# EasyEDA Pro project ProPrj_ESPRESSIF32-S3_CLOCK_BAT_2026-10-18.epro

# Schematic Schematic1

## Sheets
1 schematic: Assembly Variant: Basic; Board Name: Board1; Create Date: 2026-10-18; Page Name: P1; Project Name: 8266_timer_v2; Schematic Name: Schematic1; Update Date: 2026-10-18; Company: 嘉立创EDA; Page Size: A4; Version: V1.0
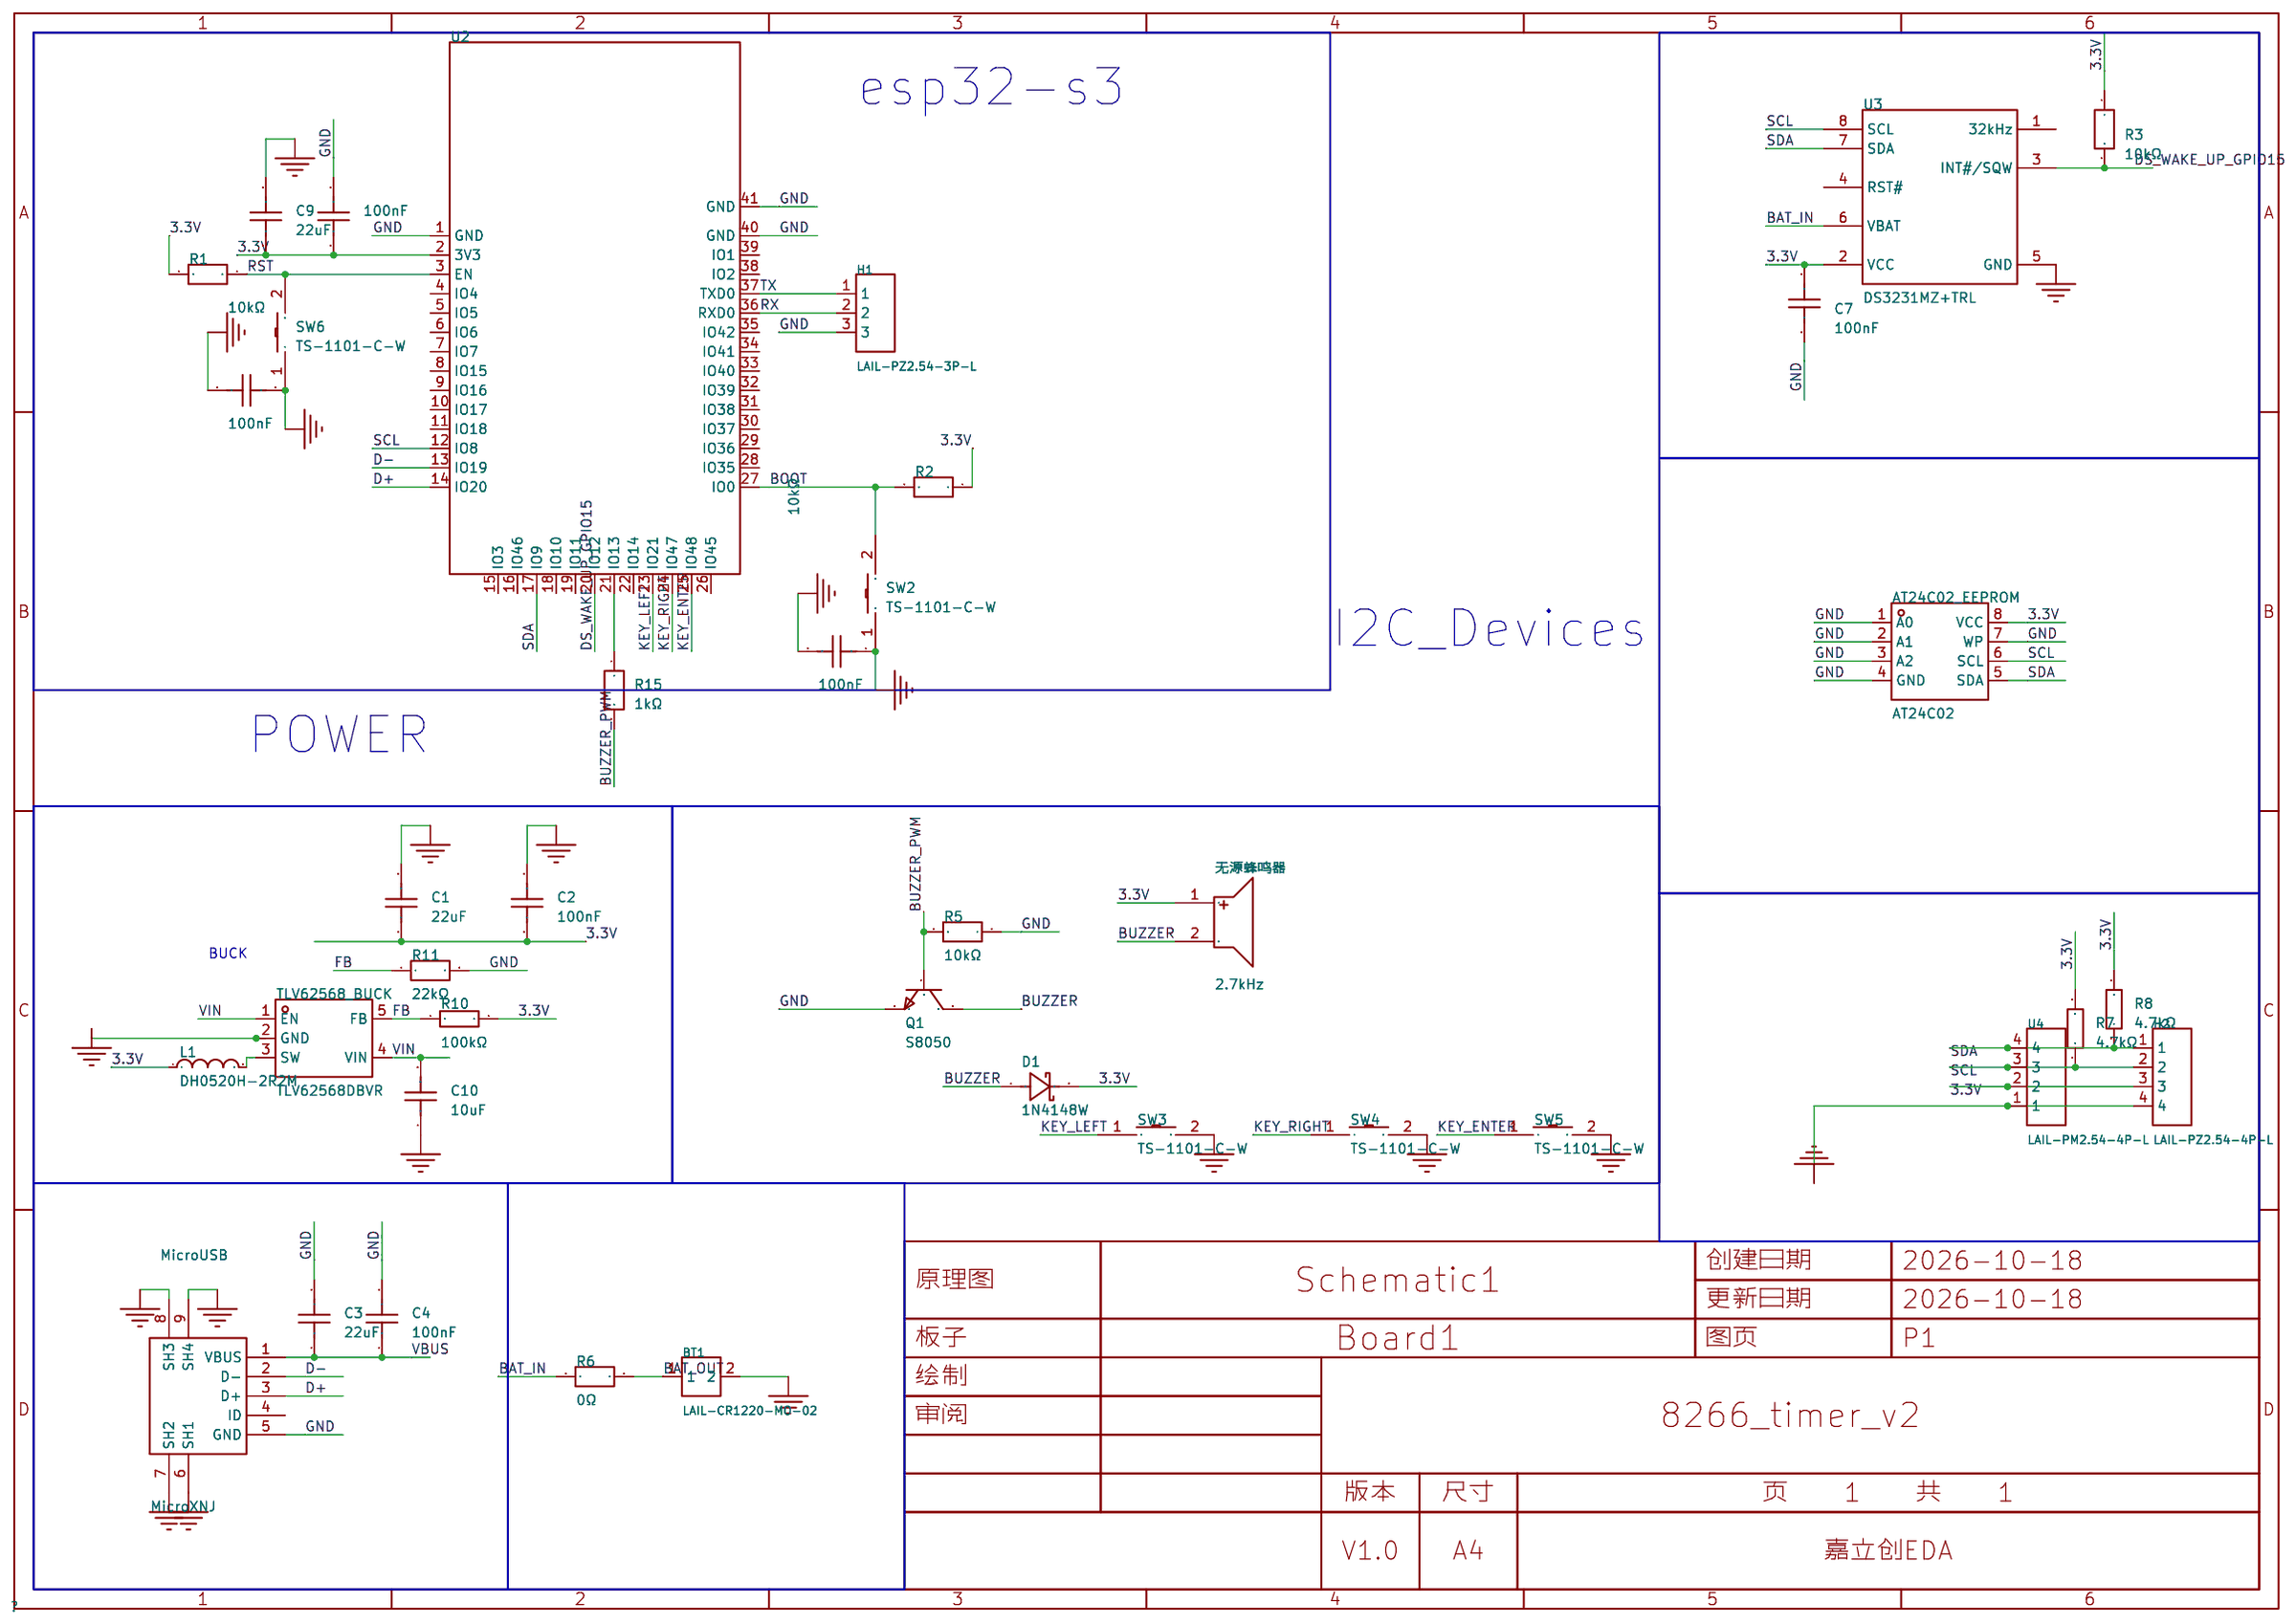
[diagram p0: schematic]
2 bat: Schematic Name: Schematic2
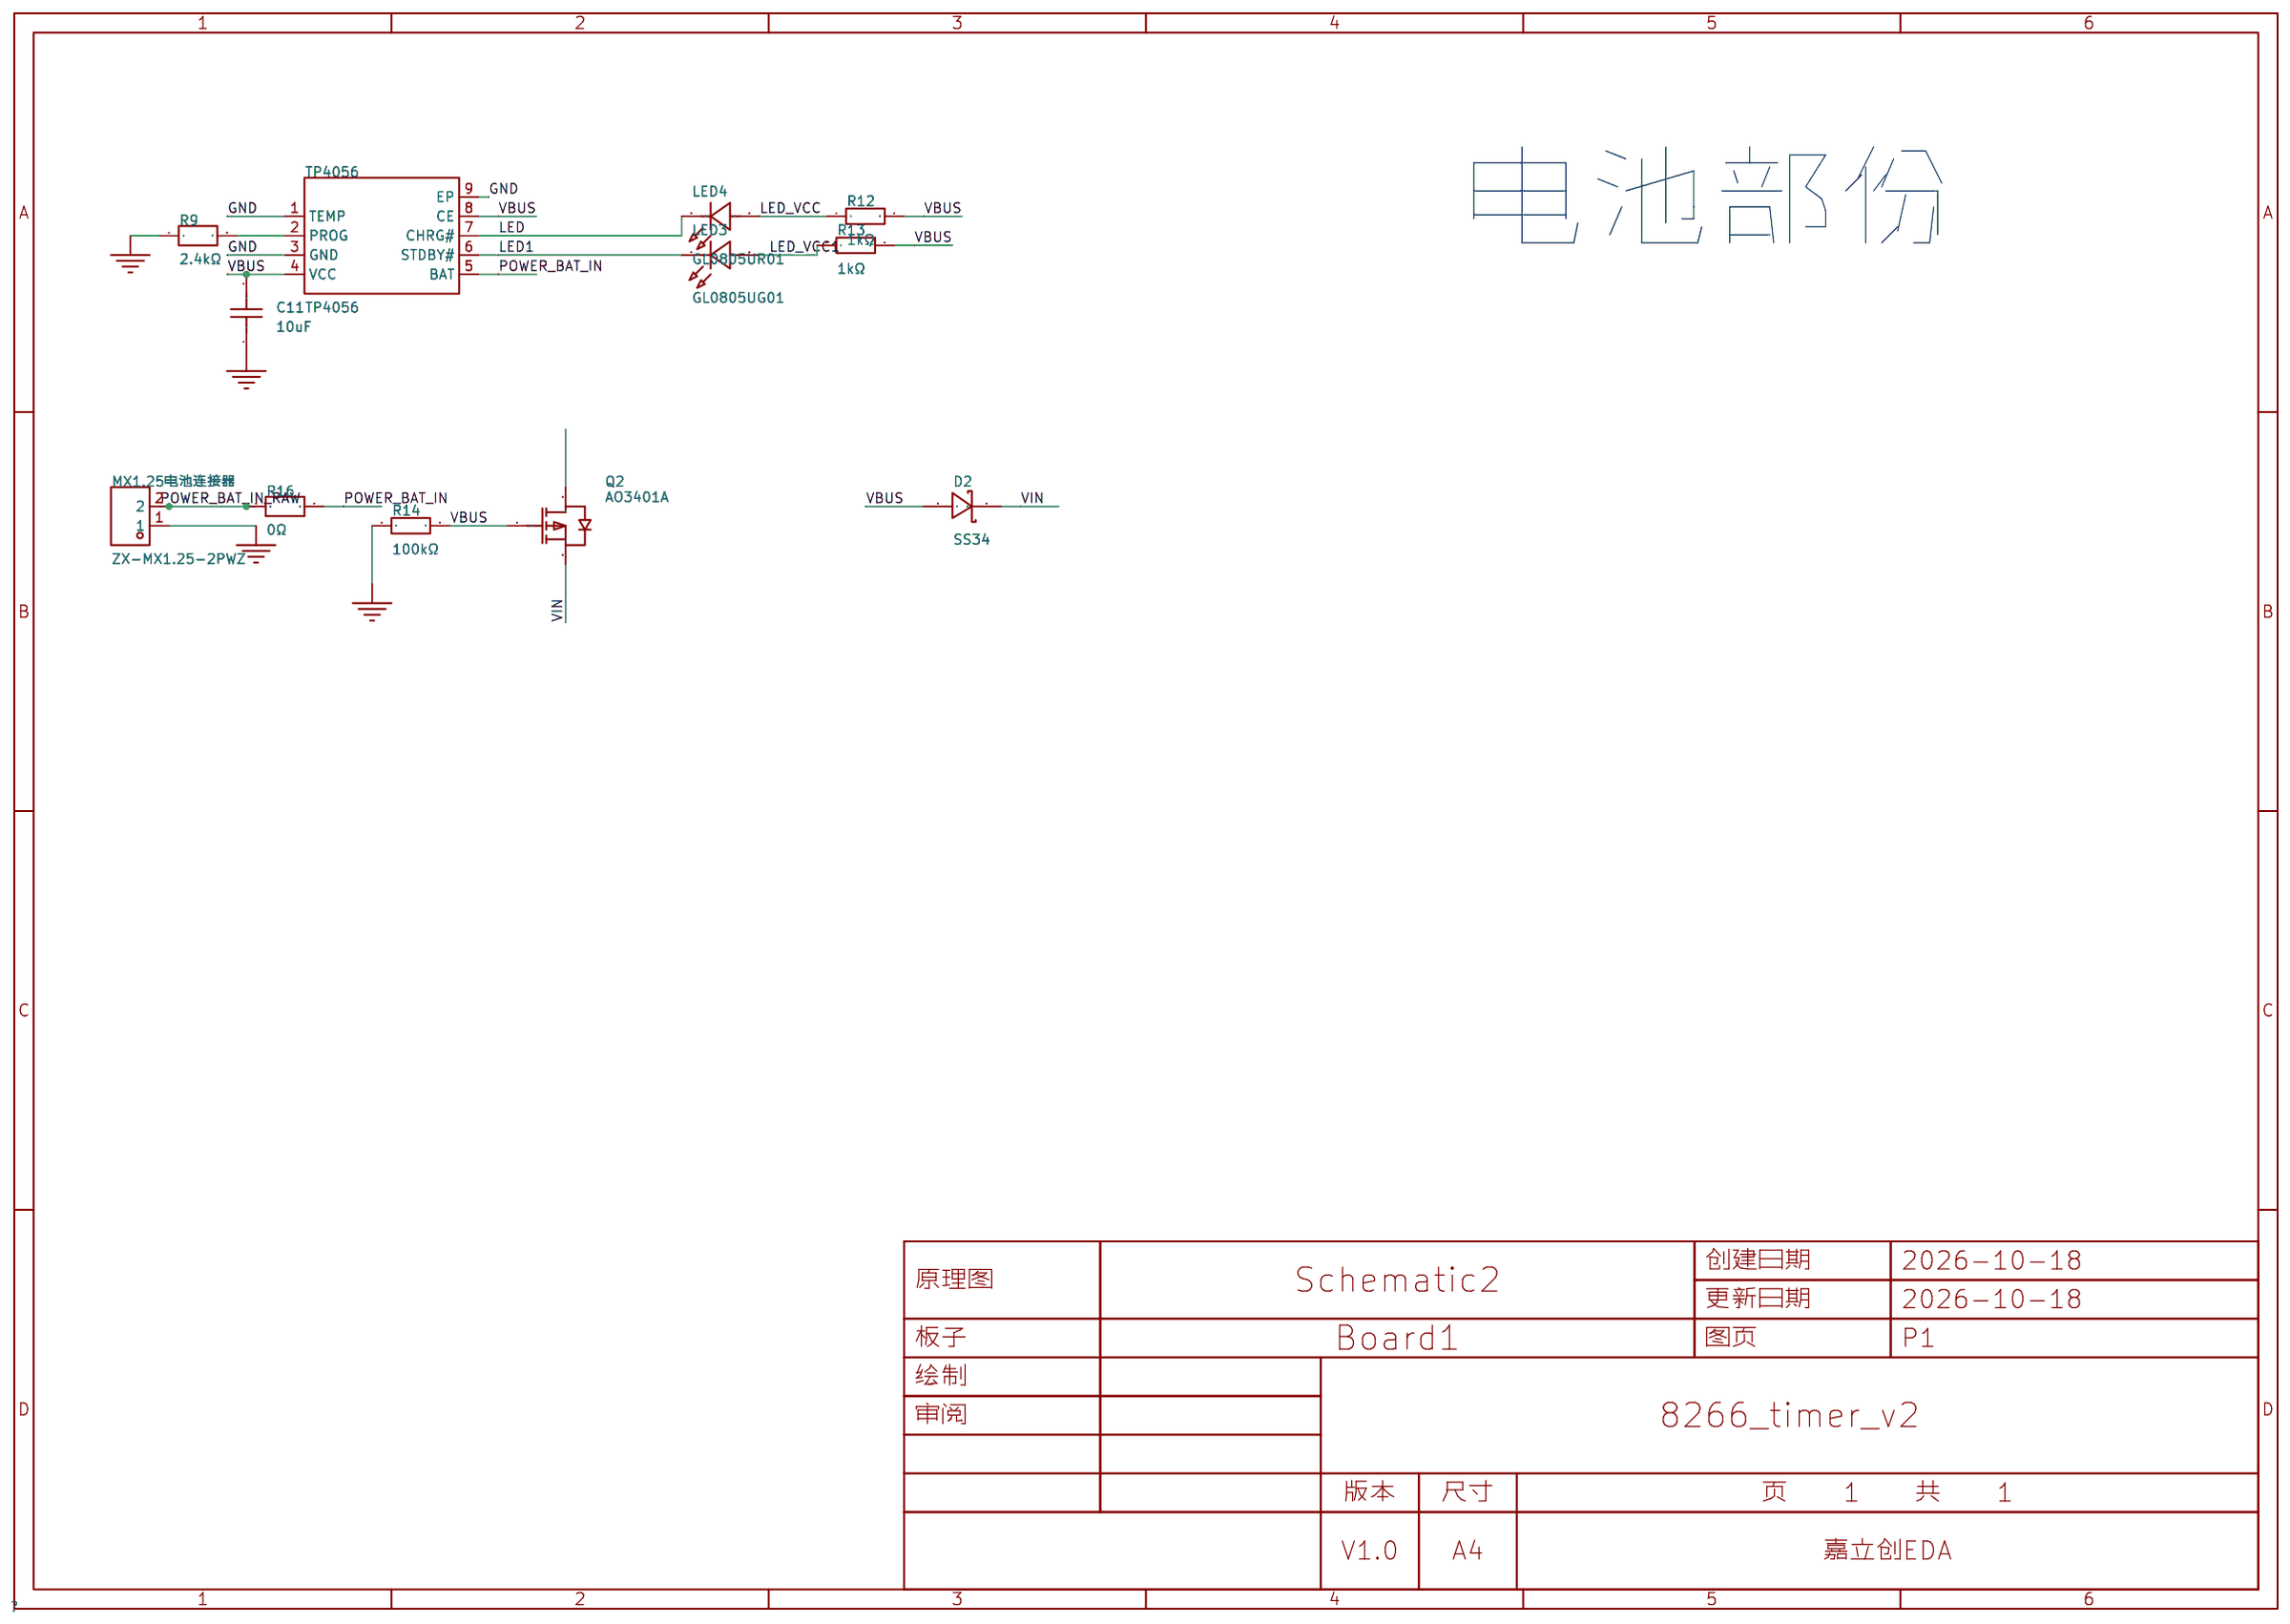
[diagram p1: bat]

## Parts
sheet bat
C11  10uF  [C0805]
D2  SS34  [SMC_L6.9-W5.9-LS7.9-RD]
LED3  GL0805UG01  [LED0805-FD_GL0805UG01]
LED4  GL0805UR01  [LED0805-R-RD_RED]
MX1.25电池连接器  ZX-MX1.25-2PWZ  [CONN-TH_2P-P1.25_ZX-MX1.25-2PWZ]
Q2  AO3401A  [SOT-23_L2.9-W1.3-P1.90-LS2.4-BR]
R9  2.4kΩ  [R0603]
R12  1kΩ  [R0805]
R13  1kΩ  [R0805]
R14  100kΩ  [R0805]
R16  0Ω  [R1206]
TP4056  TP4056  [ESOP-8_L4.9-W3.9-P1.27-LS6.0-BL-EP]
sheet schematic
AT24C02_EEPROM  AT24C02  [SOP-8_L5.0-W4.0-P1.27-LS6.0-BL]
BT1  LAIL-CR1220-MO-02  [BAT_TH_LAIL-CR1220-MO-02]
C1  22uF  [C1210]
C2  100nF  [C0805]
C3  22uF  [C0805]
C4  100nF  [C0805]
C5  100nF  [C0805]
C6  100nF  [C0805]
C7  100nF  [C0805]
C8  100nF  [C0805]
C9  22uF  [C1210]
C10  10uF  [C0805]
D1  1N4148W  [SOD-123_L2.7-W1.6-LS3.7-FD]
H1  LAIL-PZ2.54-3P-L  [HDR-TH_3P-P2.54-V-M-1]
H2  LAIL-PZ2.54-4P-L  [CONN-TH_LAIL-PZ2.54-4P-L]
L1  DH0520H-2R2M  [IND-SMD_L5.6-W5.2_MST0530H-150M]
MicroUSB  MicroXNJ  [MICRO-USB-SMD_MICROXNJ_1]
Q1  S8050  [SOT-23-3_L2.9-W1.3-P1.90-LS2.3-BR]
R1  10kΩ  [R0603]
R2  10kΩ  [R0603]
R3  10kΩ  [R0603]
R5  10kΩ  [R0603]
R6  0Ω  [R1206]
R7  4.7kΩ  [R0603]
R8  4.7kΩ  [R0603]
R10  100kΩ  [R0805]
R11  22kΩ  [R0805]
R15  1kΩ  [R0603]
SW2  TS-1101-C-W  [SW-SMD_L6.0-W3.3-LS8.0_TS-1101-C-W]
SW3  TS-1101-C-W  [SW-SMD_L6.0-W3.3-LS8.0_TS-1101-C-W]
SW4  TS-1101-C-W  [SW-SMD_L6.0-W3.3-LS8.0_TS-1101-C-W]
SW5  TS-1101-C-W  [SW-SMD_L6.0-W3.3-LS8.0_TS-1101-C-W]
SW6  TS-1101-C-W  [SW-SMD_L6.0-W3.3-LS8.0_TS-1101-C-W]
TLV62568_BUCK  TLV62568DBVR  [SOT-23-5_L3.0-W1.7-P0.95-LS2.8-BR]
U2  2.4GHz  [WIRELM-SMD_ESP32-S3-WROOM-1]
U3  DS3231MZ+TRL  [SOIC-8_L4.9-W3.9-P1.27-LS6.0-BL]
U4  LAIL-PM2.54-4P-L  [HDR-TH_4P-P2.54-V-F]
无源蜂鸣器  2.7kHz  [BUZ-TH_BD9.0-P4.00-D0.6-FD]

## Library data of the parts
C10 C11 = CL21A106KAYNNNE_C15850: 容值:10uF;精度:±10%;额定电压:25V;温度系数:X5R;; LCSC Part Name: 10uF ±10% 25V; Supplier Part: C15850; Manufacturer: SAMSUNG(三星); Manufacturer Part: CL21A106KAYNNNE; Supplier Footprint: 0805; JLCPCB Part Class: Basic Part; Datasheet: https://item.szlcsc.com/datasheet/CL21A106KAYNNNE/16532.html; Supplier: LCSC; Tolerance: ±10%; Voltage Rating: 25V; Temperature Coefficient: X5R
D2 = SS34_C154551: 正向压降(Vf):500mV@3A;直流反向耐压(Vr):40V;整流电流:3A;; LCSC Part Name: 电压:40V 电流:3A; Supplier Part: C154551; Manufacturer: onsemi(安森美); Supplier Footprint: SMC(DO-214AB); JLCPCB Part Class: Extended Part; Datasheet: https://item.szlcsc.com/datasheet/SS34/165893.html; Supplier: LCSC; Voltage - Forward(Vf@If): 500mV@3A; Voltage - DC Reverse(Vr): 40V; Current - Rectified: 3A; Reverse Leakage Current (Ir): 500uA@40V; Operating Junction Temperature Range: -55℃~+150℃; Non-Repetitive Peak Forward Surge Current: 100A
LED3 = GL0805UG01: 灯头类型:2mmx1.25mm方形灯头;发光颜色:翠绿色;正向压降(Vf):2.5V~3V;功率:-;测试电流:5mA;波长:510nm~531nm;二极管配置:独立二极管;透镜颜色:无色透明透镜;色温:-;发光强度:144mcd~300mcd;发光角度:120°;载带方式:正贴;工作温度:-40℃~+85℃;; LCSC Part Name: 0805 翠绿 高亮; Supplier Part: C51933308; Manufacturer: Guiguang light(桂光光电); Supplier Footprint: 0805; JLCPCB Part Class: Extended Part; Datasheet: https://item.szlcsc.com/datasheet/GL0805UG01/54646004.html; Supplier: LCSC; Lamp Holder Type: 2mmx1.25mm方形灯头; Illumination Color: 翠绿色; Voltage - Forward(Vf): 2.5V~3V; Test Current: 5mA; Wavelength - Dominant: 510nm~531nm; Diode Configuration: 独立二极管; Lens Color: 无色透明透镜; Luminous Intensity: 144mcd~300mcd; Viewing Angle: 120°; Mounting Style: 正贴; Operating Temperature: -40℃~+85℃
LED4 = GL0805UR01: 灯头类型:2mmx1.25mm方形灯头;发光颜色:红色;正向压降(Vf):1.8V~2.1V;功率:-;测试电流:20mA;波长:620nm~625nm;二极管配置:独立二极管;透镜颜色:无色透明透镜;色温:-;发光强度:80mcd~100mcd;发光角度:120°;载带方式:正贴;工作温度:-40℃~+85℃;; LCSC Part Name: 0805 红灯 高亮; Supplier Part: C51933307; Manufacturer: Guiguang light(桂光光电); Supplier Footprint: 0805; JLCPCB Part Class: Extended Part; Datasheet: https://item.szlcsc.com/datasheet/GL0805UR01/54646003.html; Supplier: LCSC; Lamp Holder Type: 2mmx1.25mm方形灯头; Illumination Color: 红色; Voltage - Forward(Vf): 1.8V~2.1V; Test Current: 20mA; Wavelength - Dominant: 620nm~625nm; Diode Configuration: 独立二极管; Lens Color: 无色透明透镜; Luminous Intensity: 80mcd~100mcd; Viewing Angle: 120°; Mounting Style: 正贴; Operating Temperature: -40℃~+85℃
MX1.25电池连接器 = ZX-MX1.25-2PWZ: 插针结构:1x2P;间距:1.25mm;安装方式:弯插;参考系列:PicoBlade(MX 1.25);总PIN数:2P;排数:1;每排PIN数:2;行距:-;额定电流:1A;触头材质:黄铜;触头镀层:锡;工作温度:-25℃~+85℃;; LCSC Part Name: 1x2P 间距:1.25mm 弯插 系列:PicoBlade(MX 1.25); Supplier Part: C7430463; Manufacturer: Megastar(兆星); Supplier Footprint: 弯插,P=1.25mm; JLCPCB Part Class: Extended Part; Datasheet: https://item.szlcsc.com/datasheet/ZX-MX1.25-2PWZ/8430332.html; Supplier: LCSC; Pins Structure: 1x2P; Pitch: 1.25mm; Mounting Type: 弯插; Reference Series: PicoBlade(MX 1.25); Number of Pins: 2P; Number of Rows: 1; Number of PINs Per Row: 2; Current Rating: 1A; Contact Material: 黄铜; Contact Plating: 锡; Operating Temperature: -25℃~+85℃; Voltage Rating: 125V; Plastic Material: LCP; Flame Retardant Rating: UL94V-0; Color: 米色; Z-Height of the Board: 3.3mm; X-Length of Bottom Edge on Board (Spacing Line): 4.4mm; Y-Width of Bottom Edge on Board: 4.6mm
Q2 = AO3401A_C15127: 数量:1个P沟道;漏源电压(Vdss):30V;连续漏极电流(Id):4A;导通电阻(RDS(on)):47mΩ@10V；85mΩ@2.5V；60mΩ@4.5V;耗散功率(Pd):-;阈值电压(Vgs(th)):900mV;; LCSC Part Name: 1个P沟道 耐压:30V 电流:4A; Supplier Part: C15127; Manufacturer: AOS; Supplier Footprint: SOT-23; JLCPCB Part Class: Basic Part; Datasheet: https://item.szlcsc.com/datasheet/AO3401A/15801.html; Supplier: LCSC; Number: 1个P沟道; Drain to Source Voltage: 30V; Current - Continuous Drain(Id): 4A; RDS(on): 47mΩ@10V；85mΩ@2.5V；60mΩ@4.5V; Gate Threshold Voltage (Vgs(th)): 900mV; Gate Charge(Qg): 14nC@10V; Input Capacitance(Ciss): 645pF; Reverse Transfer Capacitance (Crss@Vds): 55pF; Output Capacitance(Coss): 80pF
R9 = FRC0603F2401TS: 电阻类型:厚膜电阻;阻值:2.4kΩ;精度:±1%;功率:100mW;工作电压:75V;温度系数:±100ppm/℃;; LCSC Part Name: 2.4kΩ ±1% 100mW 厚膜电阻; Supplier Part: C2907007; Manufacturer: FOJAN(富捷); Supplier Footprint: 0603; JLCPCB Part Class: Extended Part; Supplier: LCSC; Type: 厚膜电阻; Tolerance: ±1%; Power(Watts): 100mW; Voltage-Supply(Max): 75V; Temperature Coefficient: ±100ppm/℃; Operating Temperature: -55℃~+155℃
R12 R13 = 0805W8F1001T5E: 电阻类型:厚膜电阻;阻值:1kΩ;精度:±1%;功率:125mW;最大工作电压:150V;温度系数:±100ppm/℃;; LCSC Part Name: 1kΩ ±1% 125mW 厚膜电阻; Supplier Part: C17513; Manufacturer: UNI-ROYAL(厚声); Supplier Footprint: 0805; JLCPCB Part Class: Basic Part; Datasheet: https://atta.szlcsc.com/upload/public/pdf/source/20200306/C422600_1E6D84923E4A46A82E41ADD87F860B5C.pdf; Supplier: LCSC; Type: 厚膜电阻; Tolerance: ±1%; Power(Watts): 125mW; Overload Voltage (Max): 150V; Temperature Coefficient: ±100ppm/℃; Operating Temperature Range: -55℃~+155℃
R10 R14 = 0805W8F1003T5E: 电阻类型:厚膜电阻;阻值:100kΩ;精度:±1%;功率:125mW;工作电压:150V;温度系数:±100ppm/℃;; LCSC Part Name: 100kΩ ±1% 125mW 厚膜电阻; Supplier Part: C149504; Manufacturer: UNI-ROYAL(厚声); Supplier Footprint: 0805; JLCPCB Part Class: Basic Part; Datasheet: https://item.szlcsc.com/datasheet/0805W8F1003T5E/160838.html; Supplier: LCSC; Type: 厚膜电阻; Tolerance: ±1%; Power(Watts): 125mW; Voltage-Supply(Max): 150V; Temperature Coefficient: ±100ppm/℃; Operating Temperature: -55℃~+155℃
R6 R16 = RE1206F1R000: 电阻类型:采样电阻；合金电阻;阻值:0Ω;精度:±1%;功率:1W;安装方式:贴片;; LCSC Part Name: 0Ω 1W 1206 ±1%; Supplier Part: C46961765; Manufacturer: JIERR(捷而瑞); Supplier Footprint: 1206; JLCPCB Part Class: Extended Part; Datasheet: https://item.szlcsc.com/datasheet/RE1206F1R000/49133304.html; Supplier: LCSC; Type: 采样电阻；合金电阻; Tolerance: ±1%; Power(Watts): 1W; Mounting Type: 贴片
TP4056 = TP4056_C725790: 工作电压:4V~6.5V;最大充电电流:1A;电池类型:锂电池;电池节数:1;; LCSC Part Name: 1A独立式线性锂离子电池充电器; Supplier Part: C725790; Manufacturer: UMW(友台半导体); Supplier Footprint: ESOP-8; JLCPCB Part Class: Extended Part; Datasheet: https://item.szlcsc.com/datasheet/TP4056/772193.html; Supplier: LCSC; The Chip Type: 充电芯片; Voltage - Supply: 4V~6.5V; Charge Current - Max: 1A; Charging Saturation Voltage: 4.2V; Type of Battery: 锂电池; Number of Cells: 1; Operating Temperature: -40℃~+85℃; Battery Temperature Detection: 支持; 0V Battery Charge: 支持; Supply Current (Iq): 35uA; Features: 恒压充电；恒流充电；自动再充电；充电终止；软启动；可编程充电电流；欠压锁定；涓流充电
AT24C02_EEPROM = AT24C02_C688857: 接口类型:I2C;存储容量:2Kbit;时钟频率(fc):1MHz;; LCSC Part Name: 24C02 2Kbit电可擦除PROM; Supplier Part: C688857; Manufacturer: IDCHIP(英锐芯); Supplier Footprint: SOP-8; JLCPCB Part Class: Extended Part; Datasheet: https://item.szlcsc.com/datasheet/AT24C02/721923.html; Supplier: LCSC; Interface: I2C; Memory Size: 2Kbit; Clock Frequency: 1MHz; Write Cycle Time(Tw): 5ms; Data Retention - TDR (Year): 100年; Write Cycle Endurance: 100万次; Features: 硬件写保护功能；噪声抑制功能; Voltage - Supply: 1.8V~5.5V; Operating Temperature: -40℃~+85℃; Operating Current: 1mA; Standby Current: 1uA; Access Time: 900ns
BT1 = LAIL-CR1220-MO-02: 连接器类型:电池扣;适用电池规格:CR1220;触头材质:磷青铜;触头镀层:镍;工作温度:-25℃~+85℃;; LCSC Part Name: 电池扣 适用电池:CR1220; Supplier Part: C55318146; Manufacturer: LAILAN(莱联); Supplier Footprint: 插件; JLCPCB Part Class: Extended Part; Datasheet: https://item.szlcsc.com/datasheet/LAIL-CR1220-MO-02/59240639.html; Supplier: LCSC; Connector Type: 电池扣; Battery Type: CR1220; Contact Material: 磷青铜; Contact Plating: 镍; Operating Temperature: -25℃~+85℃
C1 C9 = CL32A226KAJNNNE: 容值:22uF;精度:±10%;额定电压:25V;温度系数:X5R;; LCSC Part Name: 22uF ±10% 25V; Supplier Part: C52306; Manufacturer: SAMSUNG(三星); Supplier Footprint: 1210; JLCPCB Part Class: Extended Part; Datasheet: https://item.szlcsc.com/datasheet/CL32A226KAJNNNE/53320.html; Supplier: LCSC; Tolerance: ±10%; Voltage Rating: 25V; Temperature Coefficient: X5R
C2 C4 C7 = CL21B104KBCNNNC: 容值:100nF;精度:±10%;额定电压:50V;温度系数:X7R;; LCSC Part Name: 100nF ±10% 50V; Supplier Part: C1711; Manufacturer: SAMSUNG(三星); Supplier Footprint: 0805; JLCPCB Part Class: Extended Part; Datasheet: https://item.szlcsc.com/datasheet/CL21B104KBCNNNC/2063.html; Supplier: LCSC; Tolerance: ±10%; Voltage Rating: 50V; Temperature Coefficient: X7R
C3 = HGC0805R5226M250NSLJ: 容值:22uF;精度:±20%;额定电压:25V;温度系数:X5R;; LCSC Part Name: 22uF ±20% 25V; Supplier Part: C33546009; Manufacturer: Chinocera(华瓷); Supplier Footprint: 0805; JLCPCB Part Class: Extended Part; Datasheet: https://item.szlcsc.com/datasheet/HGC0805R5226M250NSLJ/35278487.html; Supplier: LCSC; Tolerance: ±20%; Voltage Rating: 25V; Temperature Coefficient: X5R
C5 C6 C8 = CC0805KRX7R9BB104: 容值:100nF;精度:±10%;额定电压:50V;温度系数:X7R;; LCSC Part Name: 100nF ±10% 50V; Supplier Part: C49678; Manufacturer: YAGEO(国巨); Supplier Footprint: 0805; JLCPCB Part Class: Basic Part; Datasheet: https://item.szlcsc.com/datasheet/CC0805KRX7R9BB104/50686.html; Supplier: LCSC; Tolerance: ±10%; Voltage Rating: 50V; Temperature Coefficient: X7R
D1 = 1N4148W_C7420318: 二极管配置:独立式;整流电流:150mA;直流反向耐压(Vr):100V;正向压降(Vf):1.25V@150mA;反向恢复时间(Trr):4ns;; LCSC Part Name: 100V 150mA; Supplier Part: C7420318; Manufacturer: R+O(宏嘉诚); Supplier Footprint: SOD-123; JLCPCB Part Class: Extended Part; Datasheet: https://item.szlcsc.com/datasheet/1N4148W/8397140.html; Supplier: LCSC; Diode Configuration: 独立式; Pd - Power Dissipation: 400mW; Current - Rectified: 150mA; Voltage - DC Reverse(Vr): 100V; Voltage - Forward(Vf@If): 1.25V@150mA; Non-Repetitive Peak Forward Surge Current: 2A; Reverse Leakage Current (Ir): 1uA@75V; Reverse Recovery Time (trr): 4ns; Operating Junction Temperature Range: -55℃~+150℃
H1 = LAIL-PZ2.54-3P-L: 插针结构:1x3P;间距:2.54mm;圆针/方针:方针;安装方式:直插;排数:单排;总PIN位数:3P;额定电流:3A;额定电压:250V;配合针长度:6mm;塑高:2.5mm;端接针长度:3mm;触头材质:黄铜;触头镀层:金;工作温度:-25℃~+80℃;颜色:黑色;; LCSC Part Name: 1x3P 间距:2.54mm 方针 直插; Supplier Part: C54950604; Manufacturer: LAILAN(莱联); Supplier Footprint: 插件,P=2.54mm; JLCPCB Part Class: Extended Part; Datasheet: https://item.szlcsc.com/datasheet/LAIL-PZ2.54-3P-L/58519957.html; Supplier: LCSC; Pin Structure: 1x3P; Pitch: 2.54mm; Circluar Pins/Square Pins: 方针; Mounting Type: 直插; Number of Rows: 单排; Number of Pins: 3P; Current Rating: 3A; Voltage Rating (Max): 250V; Length of Mating Pin: 6mm; Insulation Height: 2.5mm; Length of End Connection Pin: 3mm; Contact Material: 黄铜; Contact Plating: 金; Operating Temperature: -25℃~+80℃; Color: 黑色
H2 = LAIL-PZ2.54-4P-L: 插针结构:1x4P;间距:2.54mm;圆针/方针:方针;安装方式:直插;排数:单排;总PIN位数:4P;额定电流:3A;额定电压:250V;配合针长度:6mm;塑高:2.5mm;端接针长度:3mm;触头材质:黄铜;触头镀层:金;工作温度:-25℃~+80℃;颜色:黑色;; LCSC Part Name: 1x4P 间距:2.54mm 方针 直插; Supplier Part: C54950602; Manufacturer: LAILAN(莱联); Supplier Footprint: 插件,P=2.54mm; JLCPCB Part Class: Extended Part; Datasheet: https://item.szlcsc.com/datasheet/LAIL-PZ2.54-4P-L/58519955.html; Supplier: LCSC; Pin Structure: 1x4P; Pitch: 2.54mm; Circluar Pins/Square Pins: 方针; Mounting Type: 直插; Number of Rows: 单排; Number of Pins: 4P; Current Rating: 3A; Voltage Rating (Max): 250V; Length of Mating Pin: 6mm; Insulation Height: 2.5mm; Length of End Connection Pin: 3mm; Contact Material: 黄铜; Contact Plating: 金; Operating Temperature: -25℃~+80℃; Color: 黑色
L1 = DH0520H-2R2M: 一体成型电感，功率电感，合金电感，贴片电感.公司通过ISO90001:2015和IATF16949:2016体系认证，产品主要应用于：汽车电子(车灯、车机屏、BMS、自动驾驶控制模块等)、电脑主板(台式、笔记本、平板)、显卡、交换机、路由器、电视机、显示器、音箱、手机、通讯基站、各种机器设备控制板等。; LCSC Part Name: DH0520H-2R2M（2.2uH); Supplier Part: C41407019; Manufacturer: DH(德鸿感应); Supplier Footprint: SMD,5.6x5.2mm; Datasheet: https://item.szlcsc.com/datasheet/DH0520H-2R2M/43206035.html; Supplier: LCSC
MicroUSB = MicroXNJ: 连接器类型:Micro-B;协议标准:USB 2.0;公母:母;安装方式:卧贴;触点数量:5P;端口数量:1;额定电流 - 电源:1.8A;工作温度:-30℃~+80℃;; LCSC Part Name: Micro-B 母 卧贴; Supplier Part: C404969; Manufacturer: SHOU HAN(首韩); Supplier Footprint: SMD; JLCPCB Part Class: Extended Part; Datasheet: https://item.szlcsc.com/datasheet/MicroXNJ/392534.html; Supplier: LCSC; Connector Type: Micro-B; Protocol Standard: USB 2.0; Gender: 母; Mounting Type: 卧贴; Number of Contacts: 5P; Number of Ports: 1; Current Rating-Power: 1.8A; Voltage Rating: 30V; Connect-Disconnect Life: 2千次; Length: 5.7mm; Detection color: 黑色; Operating Temperature: -30℃~+80℃
Q1 = S8050_C20069125: 晶体管类型:NPN;集电极电流(Ic):500mA;集射极击穿电压(Vceo):25V;耗散功率(Pd):300mW;直流电流增益(hFE):120;; LCSC Part Name: hFE:200-350，丝印:J3Y NPN 500mA 25V; Supplier Part: C20069125; Manufacturer: R+O(宏嘉诚); Supplier Footprint: SOT-23; JLCPCB Part Class: Extended Part; Datasheet: https://item.szlcsc.com/datasheet/S8050/21397163.html; Supplier: LCSC; type: NPN; Current - Collector(Ic): 500mA; Collector - Emitter Voltage VCEO: 25V; Pd - Power Dissipation: 300mW; DC Current Gain: 120; Transition frequency(fT): 100MHz; Current - Collector Cutoff: 100nA; Vce Saturation(VCE(sat)): 600mV; Operating Temperature: -55℃~+150℃; Emitter-Base Voltage(Vebo): 5V; Number: 1个NPN; Configuration: 独立式
R1-R3 R5 = FRC0603F1002TS: 电阻类型:厚膜电阻;阻值:10kΩ;精度:±1%;功率:100mW;工作电压:75V;温度系数:±100ppm/℃;; LCSC Part Name: 10kΩ ±1% 100mW 厚膜电阻; Supplier Part: C2906982; Manufacturer: FOJAN(富捷); Supplier Footprint: 0603; JLCPCB Part Class: Extended Part; Datasheet: https://item.szlcsc.com/datasheet/FRC0603F1002TS/3180495.html; Supplier: LCSC; Type: 厚膜电阻; Tolerance: ±1%; Power(Watts): 100mW; Voltage-Supply(Max): 75V; Temperature Coefficient: ±100ppm/℃; Operating Temperature: -55℃~+155℃
R7 R8 = 0603WAF4701T5E: 电阻类型:厚膜电阻;阻值:4.7kΩ;精度:±1%;功率:100mW;工作电压:75V;温度系数:±100ppm/℃;; LCSC Part Name: 厚膜电阻 4.7kΩ ±1%; Supplier Part: C23162; Manufacturer: UNI-ROYAL(厚声); Supplier Footprint: 0603; JLCPCB Part Class: Basic Part; Datasheet: https://item.szlcsc.com/datasheet/0603WAF4701T5E/23889.html; Supplier: LCSC; Type: 厚膜电阻; Tolerance: ±1%; Power(Watts): 100mW; Voltage-Supply(Max): 75V; Temperature Coefficient: ±100ppm/℃; Operating Temperature: -55℃~+155℃
R11 = FRC0805F2202TS: 电阻类型:厚膜电阻;阻值:22kΩ;精度:±1%;功率:125mW;工作电压:150V;温度系数:±100ppm/℃;; LCSC Part Name: 22kΩ ±1% 125mW 厚膜电阻; Supplier Part: C2907243; Manufacturer: FOJAN(富捷); Supplier Footprint: 0805; JLCPCB Part Class: Extended Part; Datasheet: https://item.szlcsc.com/datasheet/FRC0805F2202TS/3180756.html; Supplier: LCSC; Type: 厚膜电阻; Tolerance: ±1%; Power(Watts): 125mW; Voltage-Supply(Max): 150V; Temperature Coefficient: ±100ppm/℃; Operating Temperature: -55℃~+155℃
R15 = FRC0603F1001TS: 电阻类型:厚膜电阻;阻值:1kΩ;精度:±1%;功率:100mW;工作电压:75V;温度系数:±100ppm/℃;; LCSC Part Name: 1kΩ ±1% 100mW 厚膜电阻; Supplier Part: C2907002; Manufacturer: FOJAN(富捷); Supplier Footprint: 0603; JLCPCB Part Class: Extended Part; Datasheet: https://item.szlcsc.com/datasheet/FRC0603F1001TS/3180515.html; Supplier: LCSC; Type: 厚膜电阻; Tolerance: ±1%; Power(Watts): 100mW; Voltage-Supply(Max): 75V; Temperature Coefficient: ±100ppm/℃; Operating Temperature: -55℃~+155℃
SW2-SW6 = TS-1101-C-W: 电路结构:单刀单掷;按钮形状:矩形按钮;作用力:2.6N;安装方式:立贴;开关长度:6mm;开关宽度:3.6mm;开关高度:2.5mm;带支架:不带支架;触点电流:50mA;额定电压:12V;带灯:无;工作寿命:5万次;; LCSC Part Name: 6*3.6*2.5mm 立贴 轻触开关; Supplier Part: C318938; Manufacturer: XKB Connection(中国星坤); Supplier Footprint: SMD,6x3.6mm; JLCPCB Part Class: Extended Part; Datasheet: https://item.szlcsc.com/datasheet/TS-1101-C-W/300030.html; Supplier: LCSC; Circuit: 单刀单掷; Actuator Style: 矩形按钮; Operating Force: 2.6N; Mounting Type: 立贴; Length: 6mm; Width: 3.6mm; Switch Height: 2.5mm; with Bracket: 不带支架; Contact Current: 50mA; Voltage Rating: 12V; With Lamp: 无; Life: 5万次; Operating Temperature: -30℃~+85℃
TLV62568_BUCK = TLV62568DBVR: 功能类型:降压型;工作电压:2.5V~5.5V;输出电压:600mV~5.5V;输出电流:1A;输出类型:可调;; LCSC Part Name: 降压型 1A 2.5V~5.5V; Supplier Part: C163219; Manufacturer: TI(德州仪器); Supplier Footprint: SOT-23-5; JLCPCB Part Class: Extended Part; Datasheet: https://www.ti.com/cn/lit/ds/symlink/tlv62568.pdf; Supplier: LCSC; Function: 降压型; Voltage - Supply: 2.5V~5.5V; Output Voltage: 600mV~5.5V; Output Current: 1A; Frequency - Switching: 1.5MHz; Operating Temperature: -40℃~+125℃@(TJ); Synchronous Rectifier: 是; Number of Outputs: 1; Topology: 降压式; Quiescent Current: 35uA; Switch tube (built-in/external): 内置; Output Type: 可调; Features: 轻载高效模式；过流保护；工作状态指示
U2 = ESP32-S3-WROOM-1-N16R8: 核心芯片:ESP32-S3R8;频率:2.4GHz;天线形式:板载PCB天线;发射功率:20.5dBm;接收灵敏度:-103.5dBm;; LCSC Part Name: 不带固件 通用型Wi-Fi+低功耗蓝牙MCU模组; Supplier Part: C2913202; Manufacturer: ESPRESSIF(乐鑫); Supplier Footprint: SMD,25.5x18mm; JLCPCB Part Class: Extended Part; Datasheet: https://item.szlcsc.com/datasheet/ESP32-S3-WROOM-1-N16R8/3198300.html; Supplier: LCSC; Utilized IC / Part: ESP32-S3R8; Interface Type: I2C；GPIO；UART；SPI；USB；I2S; Antenna Type: 板载PCB天线; Output Power: 20.5dBm; Voltage - Supply: 3V~3.6V; Receive  Current: 95mA; Send  Current: 355mA; Sensitivity: -103.5dBm; Operating Temperature: -40℃~+65℃
U3 = DS3231MZ+TRL: 接口类型:I2C;晶振类型:内置;闹钟输出:有;; LCSC Part Name: 高精度RTC集成MEMS谐振器; Supplier Part: C107410; Manufacturer: ADI(亚德诺)/MAXIM(美信); Supplier Footprint: SOIC-8; JLCPCB Part Class: Extended Part; Datasheet: https://item.szlcsc.com/datasheet/DS3231MZ%252BTRL/108629.html; Supplier: LCSC; Interface: I2C; crystal oscillator: 内置; Alarm Output: 有; Current - Supply: 200uA; Voltage - Supply: 2.3V~5.5V; Quiescent Current(Iq): 100nA; Operating Temperature: -40℃~+85℃; Features: 备份电源管理与电池充电；温度补偿；告警功能；周期性中断输出
U4 = LAIL-PM2.54-4P-L: 插孔结构:1x4P;间距:2.54mm;圆孔/方孔:方孔;安装方式:直插;排数:单排;总孔位数:4P;额定电流:3A;额定电压:250V;插孔方向:顶部;塑高:8.5mm;触头材质:黄铜;触头镀层:金;工作温度:-25℃~+80℃;; LCSC Part Name: 1x4P 间距:2.54mm 直插; Supplier Part: C54973823; Manufacturer: LAILAN(莱联); Supplier Footprint: 插件,P=2.54mm; JLCPCB Part Class: Extended Part; Datasheet: https://item.szlcsc.com/datasheet/LAIL-PM2.54-4P-L/58554901.html; Supplier: LCSC; Holes Structure: 1x4P; Pitch: 2.54mm; Circular Hole / Square Hole: 方孔; Mounting Type: 直插; Number of Rows: 单排; Number of Positions: 4P; Current Rating: 3A; Voltage Rating (Max): 250V; Holes Direction: 顶部; Insulation Height: 8.5mm; Contact Material: 黄铜; Contact Plating: 金; Operating Temperature: -25℃~+80℃; PIN Length: 3mm
无源蜂鸣器 = QMB-09B-03: 驱动方式:无源(外部驱动);构造类型:电磁式;额定电压:3V;频率:2.7kHz;声压(SPL):85dB;; LCSC Part Name: 无源蜂鸣器QMB-09B-03; Supplier Part: C96256; Manufacturer: 华能; Supplier Footprint: 插件,D=9mm; JLCPCB Part Class: Extended Part; Datasheet: https://item.szlcsc.com/datasheet/QMB-09B-03/97460.html; Supplier: LCSC; Driver Circuitry: 无源(外部驱动); Technology: 电磁式; Voltage Rating: 3V; Voltage - Supply: 2V~5V; Current Consumption: 50mA; Sound Pressure Level(SPL): 85dB; Diameter(φD): 9mm; Height: 5.7mm; Operating Temperature: -20℃~+70℃

## Nets
3.3V: AT24C02_EEPROM.8(VCC) C1.1 C2.1 C5.2 C7.1 C9.1 D1.2(K) H2.3 L1.1 R1.1 R2.1 R3.1 R7.2 R8.2 R10.2 U2.2(3V3) U3.2(VCC) U4.2 无源蜂鸣器.1
GND: AT24C02_EEPROM.1(A0) AT24C02_EEPROM.2(A1) AT24C02_EEPROM.3(A2) AT24C02_EEPROM.4(GND) AT24C02_EEPROM.7(WP) BT1.2 C1.2 C2.2 C3.2 C4.2 C5.1 C6.1 C6.2 C7.2 C8.1 C8.2 C9.2 C10.1 C11.1 H1.3 H2.4 MicroUSB.5(GND) MicroUSB.6(SH1) MicroUSB.7(SH2) MicroUSB.8(SH3) MicroUSB.9(SH4) MX1.25电池连接器.1 Q1.2(E) R5.1 R9.1 R11.2 R14.1 SW2.1 SW3.2 SW4.2 SW5.2 SW6.1 TLV62568_BUCK.2(GND) TP4056.1(TEMP) TP4056.3(GND) TP4056.9(EP) U2.1(GND) U2.40(GND) U2.41(GND) U3.5(GND) U4.1
VBUS: C3.1 C4.1 C11.2 D2.2(A) MicroUSB.1(VBUS) Q2.1(G) R12.2 R13.2 R14.2 TP4056.4(VCC) TP4056.8(CE)
VIN: C10.2 D2.1(C) Q2.2(S) TLV62568_BUCK.1(EN) TLV62568_BUCK.4(VIN)
BAT_IN: R6.1 U3.6(VBAT)
BAT_OUT: BT1.1 R6.2
BOOT: R2.2 SW2.2 U2.27(IO0)
BUZZER: D1.1(A) Q1.3(C) 无源蜂鸣器.2
BUZZER_PWM: Q1.1(B) R5.2 R15.2
D+: MicroUSB.3(D+) U2.14(IO20)
D-: MicroUSB.2(D-) U2.13(IO19)
DS_WAKE_UP_GPIO15: R3.2 U2.20(IO12) U3.3(INT#/SQW)
FB: R10.1 R11.1 TLV62568_BUCK.5(FB)
KEY_ENTER: SW5.1 U2.25(IO48)
KEY_LEFT: SW3.1 U2.23(IO21)
KEY_RIGHT: SW4.1 U2.24(IO47)
LED: LED4.2(C) TP4056.7(CHRG#)
LED1: LED3.2(C) TP4056.6(STDBY#)
LED_VCC: LED4.1(A) R12.1
LED_VCC1: LED3.1(A) R13.1
POWER_BAT_IN: R16.2 TP4056.5(BAT)
POWER_BAT_IN_RAW: MX1.25电池连接器.2 R16.1
RST: R1.2 SW6.2 U2.3(EN)
RX: H1.2 U2.36(RXD0)
SCL: AT24C02_EEPROM.6(SCL) H2.2 R7.1 U2.12(IO8) U3.8(SCL) U4.3
SDA: AT24C02_EEPROM.5(SDA) H2.1 R8.1 U2.17(IO9) U3.7(SDA) U4.4
TX: H1.1 U2.37(TXD0)
$1N150: R15.1 U2.21(IO13)
$1N182: L1.2 TLV62568_BUCK.3(SW)
$2N7: R9.2 TP4056.2(PROG)

Not connected (* = marked no-connect by the designer): MicroUSB 4(ID); Q2 3(D); U2 4(IO4) 5(IO5) 6(IO6) 7(IO7) 8(IO15) 9(IO16) 10(IO17) 11(IO18) 15(IO3) 16(IO46) 18(IO10) 19(IO11) 22(IO14) 26(IO45) 28(IO35) 29(IO36) 30(IO37) 31(IO38) 32(IO39) 33(IO40) 34(IO41) 35(IO42) 38(IO2) 39(IO1); U3 1(32kHz) 4(RST#)

## Notes on the sheets
sheet 1
- esp32-s3
- I2C_Devices
- POWER
- BUCK
sheet 2
- 电池部份

# Board PCB1
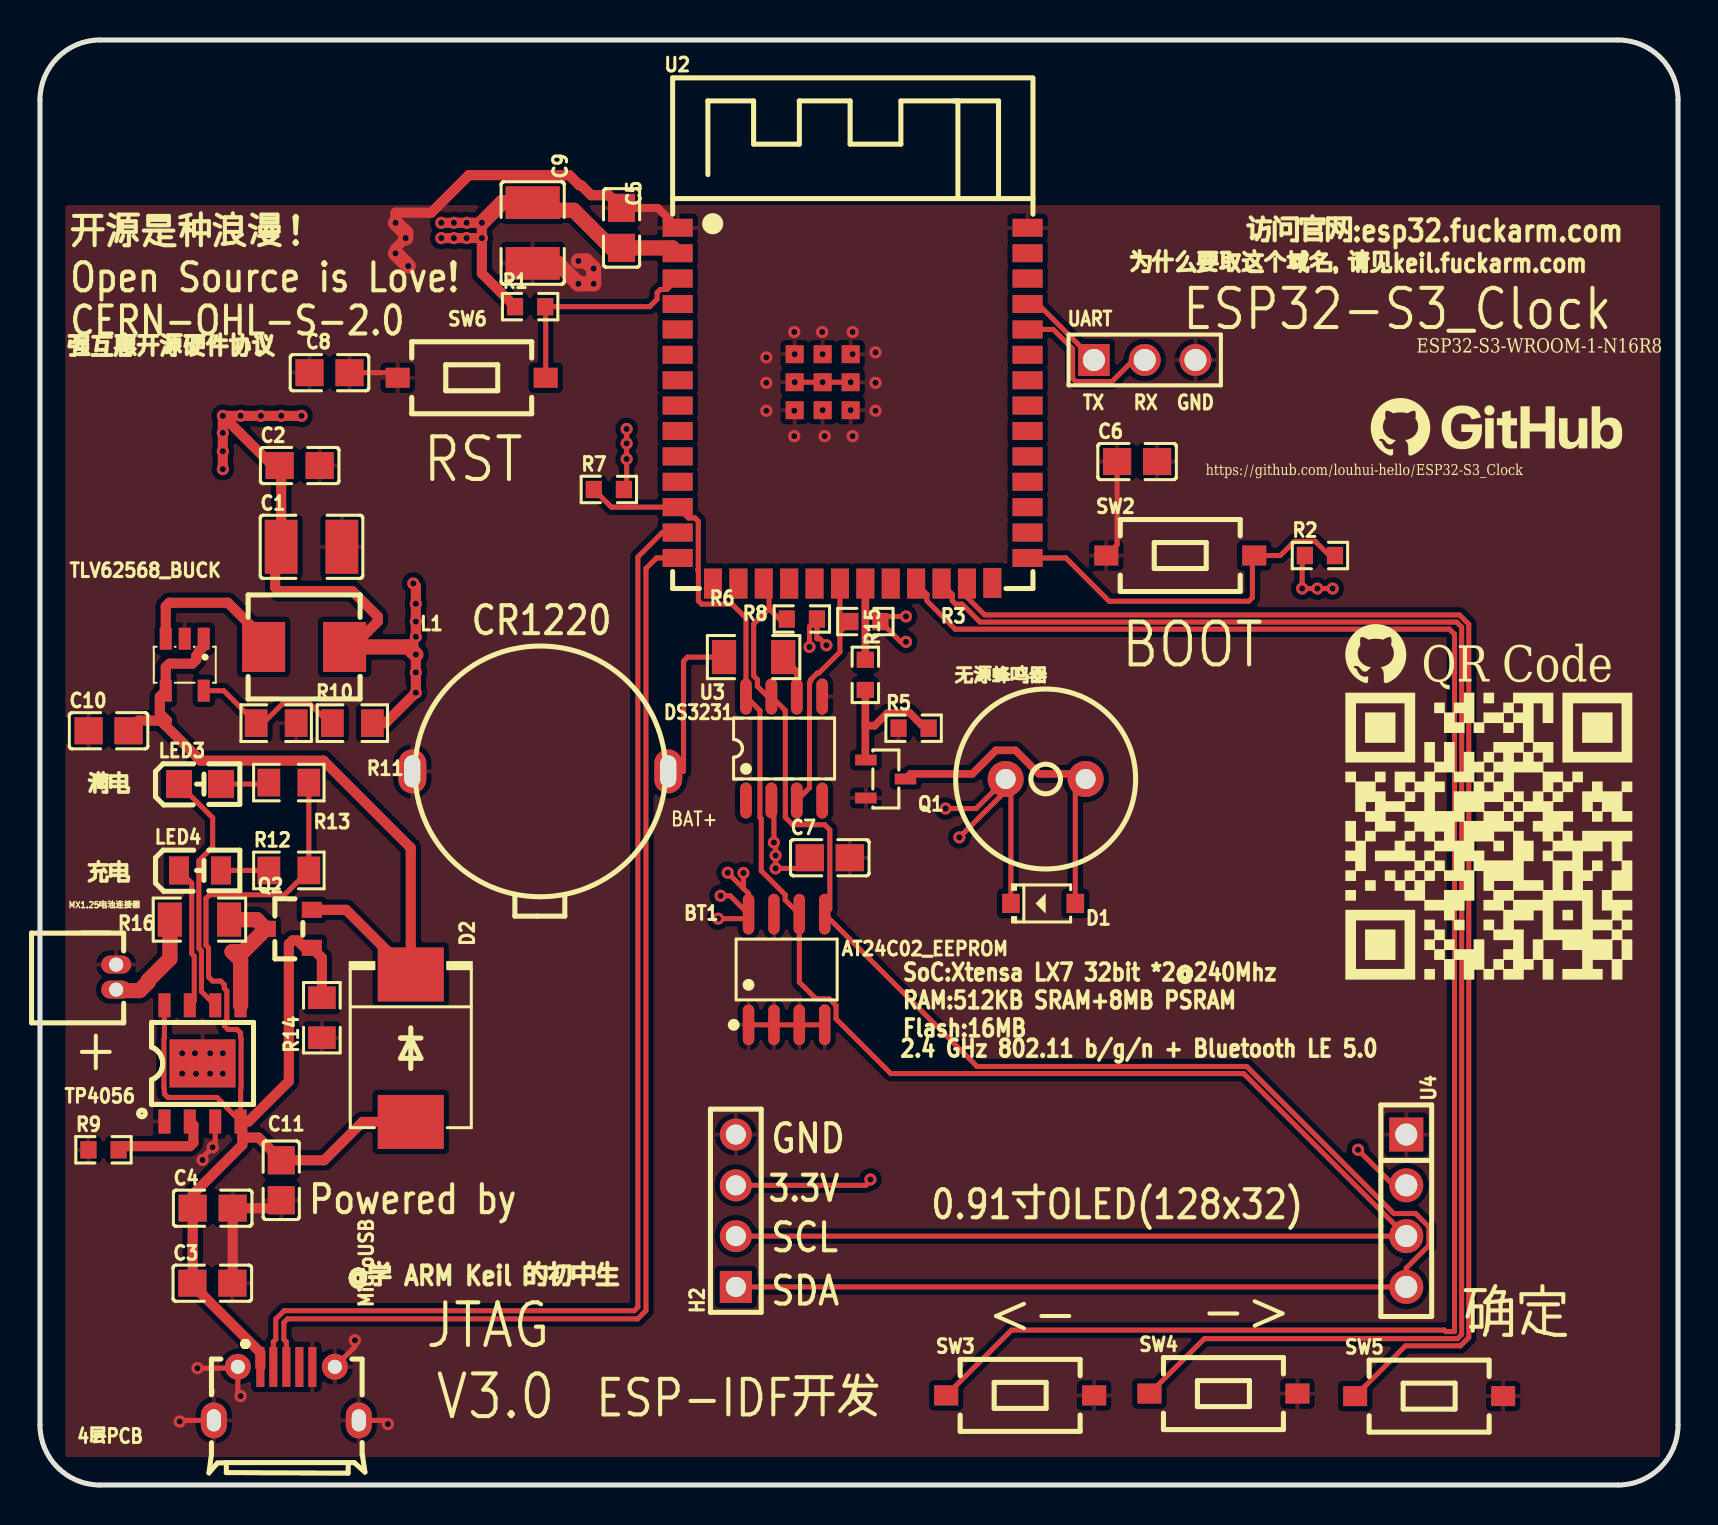
[diagram p2: board, top side]
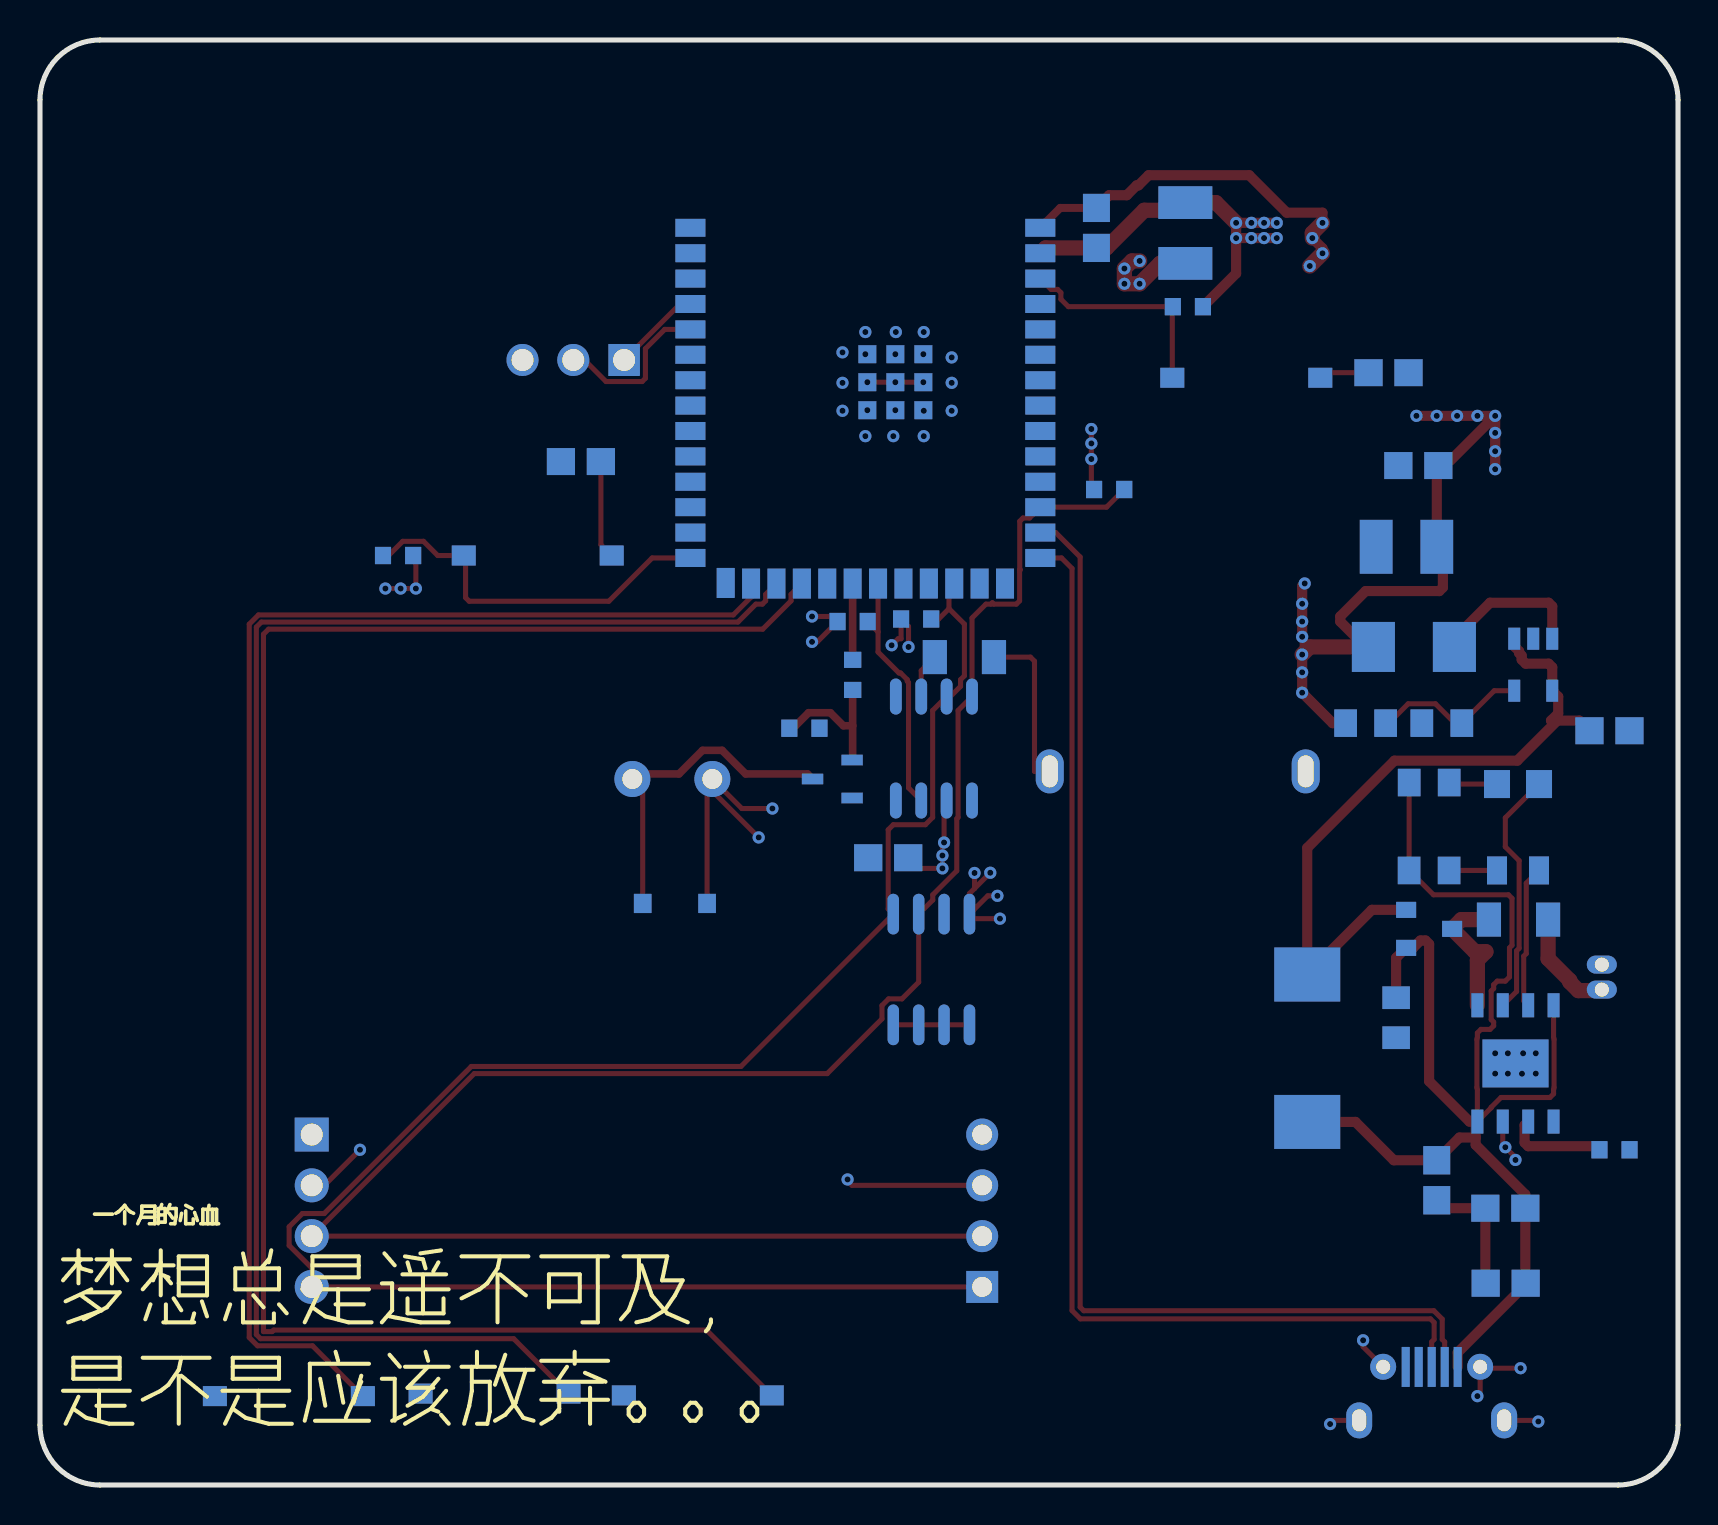
[diagram p3: board, bottom side, seen from below]

Outline 81.91 x 72.26 mm; copper layers: Top Layer, Inner1, Inner2, Bottom Layer. Coordinates in mm from the lower left corner of the outline.
Outline path: 0,69.26 0,3 arc(0.88,0.88) 3,0 78.91,0 arc(81.04,0.88) 81.91,3 81.91,69.26 arc(81.04,71.38) 78.91,72.26 3,72.26 arc(0.88,71.38) 0,69.26
Stack: Top Layer 0.035mm Outer layer thickness 1oz / Dielectric1 0.2104mm 7628 RC49% 8.6mil er 4.4 / Inner1 0.0152mm Inner layer thickness / Dielectric2 1.065mm 1.1mm H/HOZ Copper er 4.43 / Inner2 0.0152mm Inner layer thickness / Dielectric3 0.2104mm 7628 RC49% 8.6mil er 4.4 / Bottom Layer 0.035mm Outer layer thickness 1oz

## Design rules (mm)
net D-: DP1
net D+: DP1
spacing copperThickness1oz (default): track to track 0.102, other pairs 0.152 to 0.3
spacing copperThickness2oz: track to track 0.203, other pairs 0.152 to 0.3
track width copperThickness1oz (default): min 0.127, default 0.254, max 2.54
track width copperThickness2oz: min 0.203, default 0.254, max 2.54
differential pair differentialPair (default): width min 0.127, default 0.254, max 2.54; gap min 0.152, default 0.152
net 3.3V uses copperRegion
net GND uses copperRegion

## Placement (name value [footprint] x y rotation side)
AT24C02_EEPROM  AT24C02  [SOP-8_L5.0-W4.0-P1.27-LS6.0-BL]  37.34 25.78 0 top
BT1  LAIL-CR1220-MO-02  [BAT_TH_LAIL-CR1220-MO-02]  25.02 35.69 180 top
C1  22uF  [C1210]  13.58 46.92 0 top
C2  100nF  [C0805]  12.99 50.98 0 top
C3  22uF  [C0805]  8.62 10.09 0 top
C4  100nF  [C0805]  8.64 13.84 0 top
C5  100nF  [C0805]  29.08 62.86 270 top
C6  100nF  [C0805]  54.86 51.18 0 top
C7  100nF  [C0805]  39.5 31.37 0 top
C8  100nF  [C0805]  14.48 55.63 0 top
C9  22uF  [C1210]  24.64 62.61 270 top
C10  10uF  [C0805]  3.43 37.72 0 top
C11  10uF  [C0805]  12.06 15.24 90 top
D1  1N4148W  [SOD-123_L2.7-W1.6-LS3.7-FD]  50.16 29.08 180 top
D2  SS34  [SMC_L6.9-W5.9-LS7.9-RD]  18.54 21.84 270 top
H1  LAIL-PZ2.54-3P-L  [HDR-TH_3P-P2.54-V-M-1]  55.25 56.26 0 top
H2  LAIL-PZ2.54-4P-L  [CONN-TH_LAIL-PZ2.54-4P-L]  34.8 13.72 90 top
L1  DH0520H-2R2M  [IND-SMD_L5.6-W5.2_MST0530H-150M]  13.21 41.91 180 top
LED3  GL0805UG01  [LED0805-FD_GL0805UG01]  8 35.05 180 top
LED4  GL0805UR01  [LED0805-R-RD_RED]  8 30.73 0 top
MicroUSB  MicroXNJ  [MICRO-USB-SMD_MICROXNJ_1]  12.32 4.57 270 top
MX1.25电池连接器  ZX-MX1.25-2PWZ  [CONN-TH_2P-P1.25_ZX-MX1.25-2PWZ]  3.81 25.4 270 top
Q1  S8050  [SOT-23-3_L2.9-W1.3-P1.90-LS2.3-BR]  42.29 35.31 180 top
Q2  AO3401A  [SOT-23_L2.9-W1.3-P1.90-LS2.4-BR]  12.45 27.81 0 top
R1  10kΩ  [R0603]  24.51 58.93 0 top
R2  10kΩ  [R0603]  64.01 46.48 0 top
R3  10kΩ  [R0603]  41.28 43.18 180 top
R5  10kΩ  [R0603]  43.69 37.85 0 top
R6  0Ω  [R1206]  35.69 41.4 180 top
R7  4.7kΩ  [R0603]  28.45 49.78 0 top
R8  4.7kΩ  [R0603]  38.1 43.31 0 top
R9  2.4kΩ  [R0603]  3.17 16.76 0 top
R10  100kΩ  [R0805]  15.62 38.1 0 top
R11  22kΩ  [R0805]  11.81 38.1 0 top
R12  1kΩ  [R0805]  12.45 30.73 0 top
R13  1kΩ  [R0805]  12.44 35.13 0 top
R14  100kΩ  [R0805]  14.1 23.37 90 top
R15  1kΩ  [R0603]  41.28 40.51 270 top
R16  0Ω  [R1206]  7.98 28.27 0 top
SW2  TS-1101-C-W  [SW-SMD_L6.0-W3.3-LS8.0_TS-1101-C-W]  57.02 46.48 0 top
SW3  TS-1101-C-W  [SW-SMD_L6.0-W3.3-LS8.0_TS-1101-C-W]  49.02 4.48 0 top
SW4  TS-1101-C-W  [SW-SMD_L6.0-W3.3-LS8.0_TS-1101-C-W]  59.18 4.57 0 top
SW5  TS-1101-C-W  [SW-SMD_L6.0-W3.3-LS8.0_TS-1101-C-W]  69.47 4.44 0 top
SW6  TS-1101-C-W  [SW-SMD_L6.0-W3.3-LS8.0_TS-1101-C-W]  21.59 55.37 0 top
TLV62568_BUCK  TLV62568DBVR  [SOT-23-5_L3.0-W1.7-P0.95-LS2.8-BR]  7.24 41.02 90 top
TP4056  TP4056  [ESOP-8_L4.9-W3.9-P1.27-LS6.0-BL-EP]  8.13 21.08 0 top
U2  2.4GHz  [WIRELM-SMD_ESP32-S3-WROOM-1]  40.64 53.97 0 top
U3  DS3231MZ+TRL  [SOIC-8_L4.9-W3.9-P1.27-LS6.0-BL]  37.21 36.83 0 top
U4  LAIL-PM2.54-4P-L  [HDR-TH_4P-P2.54-V-F]  68.33 13.72 270 top
无源蜂鸣器  2.7kHz  [BUZ-TH_BD9.0-P4.00-D0.6-FD]  50.29 35.31 0 top

## Footprints (pads in the part's own frame, mm; a bottom-side part is the same pattern mirrored in y, then rotated)
BAT_TH_LAIL-CR1220-MO-02
  oval 1.4x2.2 hole 0.8x1.6: 1(-6.4,0) 2(6.4,0)
BUZ-TH_BD9.0-P4.00-D0.6-FD
  round 1.8 hole 1: 1(-2,0) 2(2,0)
C0805
  rect 1.41x1.35 hole 0.001: 1(-1,0) 2(1,0)
C1210
  rect 1.635x2.7 hole 0.001: 1(-1.518,0) 2(1.518,0)
CONN-TH_2P-P1.25_ZX-MX1.25-2PWZ
  oval 0.9x1.5 hole 0.7: 1(-0.625,0) 2(0.625,0)
CONN-TH_LAIL-PZ2.54-4P-L
  rect 1.6x1.6 hole 1: 1(-3.81,0)
  round 1.6 hole 1: 2(-1.27,0) 3(1.27,0) 4(3.81,0)
ESOP-8_L4.9-W3.9-P1.27-LS6.0-BL-EP
  rect 0.6x1.2 hole 0.001: 1(-1.905,-2.909) 2(-0.635,-2.909) 3(0.635,-2.909) 4(1.905,-2.909) 5(1.905,2.909) 6(0.635,2.909) 7(-0.635,2.909) 8(-1.905,2.909)
  rect 3.3x2.4 hole 0.001: 9(0,0)
HDR-TH_3P-P2.54-V-M-1
  rect 1.575x1.6 hole 1.1: 1(-2.54,0)
  round 1.6 hole 1.1: 2(0,0) 3(2.54,0)
HDR-TH_4P-P2.54-V-F
  rect 1.7x1.7 hole 1.1: 1(-3.81,0)
  round 1.7 hole 1.1: 2(-1.27,0) 3(1.27,0) 4(3.81,0)
IND-SMD_L5.6-W5.2_MST0530H-150M
  rect 2.15x2.5 hole 0.001: 1(-2.025,0) 2(2.025,0)
LED0805-FD_GL0805UG01
  rect 1.3x1.399 hole 0.001: 1(-1.05,0) 2(1.05,0)
LED0805-R-RD_RED
  rect 1x1.399 hole 0.001: 1(1.05,0) 2(-1.05,0)
MICRO-USB-SMD_MICROXNJ_1
  rect 2x0.4 hole 0.001: 1(-1.332,-1.3) 2(-1.332,-0.65) 3(-1.332,0) 4(-1.332,0.65) 5(-1.332,1.3)
  round 1.3 hole 0.7: 6(-1.34,2.425) 9(-1.34,-2.425)
  oval 1.8x1.3 hole 1.1x0.7: 7(1.34,3.625) 8(1.34,-3.625)
R0603
  rect 0.806x0.864 hole 0.001: 1(-0.753,0) 2(0.753,0)
R0805
  rect 1.133x1.377 hole 0.001: 1(-1,0) 2(1,0)
R1206
  rect 1.208x1.701 hole 0.001: 1(-1.479,0) 2(1.479,0)
SMC_L6.9-W5.9-LS7.9-RD
  rect 2.7x3.3 hole 0.001: 1(-3.687,0) 2(3.687,0)
SOD-123_L2.7-W1.6-LS3.7-FD
  rect 0.88x0.96 hole 0.001: 1(-1.61,0) 2(1.61,0)
SOIC-8_L4.9-W3.9-P1.27-LS6.0-BL
  oval 0.588x1.8 hole 0.001: 1(-1.905,-2.6) 2(-0.635,-2.6) 3(0.635,-2.6) 4(1.905,-2.6) 5(1.905,2.6) 6(0.635,2.6) 7(-0.635,2.6) 8(-1.905,2.6)
SOP-8_L5.0-W4.0-P1.27-LS6.0-BL
  oval 0.574x2.035 hole 0.001: 1(-1.905,-2.768) 2(-0.635,-2.768) 3(0.635,-2.768) 4(1.905,-2.768) 5(1.905,2.768) 6(0.635,2.768) 7(-0.635,2.768) 8(-1.905,2.768)
SOT-23-3_L2.9-W1.3-P1.90-LS2.3-BR
  rect 1.07x0.532 hole 0.001: 1(0.99,-0.95) 2(0.99,0.95) 3(-0.99,0)
SOT-23-5_L3.0-W1.7-P0.95-LS2.8-BR
  rect 1.1x0.6 hole 0.001: 1(1.3,-0.95) 2(1.3,0) 3(1.3,0.95) 4(-1.3,0.95) 5(-1.3,-0.95)
SOT-23_L2.9-W1.3-P1.90-LS2.4-BR
  rect 1x0.8 hole 0.001: 1(1.15,-0.95) 2(1.15,0.95) 3(-1.15,0)
SW-SMD_L6.0-W3.3-LS8.0_TS-1101-C-W
  rect 1.2x1 hole 0.001: 1(-3.7,0) 2(3.7,0)
WIRELM-SMD_ESP32-S3-WROOM-1
  rect 1.5x0.9 hole 0.001: 1(-8.75,8.895) 2(-8.75,7.625) 3(-8.75,6.355) 4(-8.75,5.085) 5(-8.75,3.815) 6(-8.75,2.545) 7(-8.75,1.275) 8(-8.75,0.005) 9(-8.75,-1.265) 10(-8.75,-2.535) 11(-8.75,-3.805) 12(-8.75,-5.075) 13(-8.75,-6.345) 14(-8.75,-7.615) 27(8.75,-7.615) 28(8.75,-6.345) 29(8.75,-5.075) 30(8.75,-3.805) 31(8.75,-2.535) 32(8.75,-1.265) 33(8.75,0.005) 34(8.75,1.275) 35(8.75,2.545) 36(8.75,3.815) 37(8.75,5.085) 38(8.75,6.355) 39(8.75,7.625) 40(8.75,8.895)
  rect 0.9x1.5 hole 0.001: 15(-6.985,-8.895) 16(-5.715,-8.895) 17(-4.445,-8.895) 18(-3.175,-8.895) 19(-1.905,-8.895) 20(-0.635,-8.895) 21(0.635,-8.895) 22(1.905,-8.895) 23(3.175,-8.895) 24(4.445,-8.895) 25(5.715,-8.895) 26(6.985,-8.865)
  rect 0.9x0.9 hole 0.001: 41(-2.9,2.575) 41(-2.9,1.175) 41(-2.9,-0.225) 41(-1.5,2.575) 41(-1.5,1.175) 41(-1.5,-0.225) 41(-0.1,2.575) 41(-0.1,1.175) 41(-0.1,-0.225)

## Nets
As in the schematic, except:
POWER_BAT_IN: Q2.3 R16.2 TP4056.5

Pads without a net: MicroUSB 4; U2 4 5 6 7 8 9 10 11 15 16 18 19 22 26 28 29 30 31 32 33 34 35 38 39; U3 1 4

## Via types
v1: diameter 0.61, hole 0.305, Top Layer to Bottom Layer, 88 vias

## Routing (per net, layer and track width the routed paths; a pad name or vN(x,y) marks a point on that pad's centre or on a via; arc(x,y) is an arc through that point)
3.3V: length 105.2
  Top Layer w0.254: R2.1 63.12,46.35 v1(63.12,44.83) v1(63.88,44.83) v1(64.64,44.83) ; 36.58,34.23 36.7,34.1 v1(36.7,32.13) 36.79,32.05 v1(36.79,31.48) v1(36.79,30.84) 37.96,30.84 C7.1 ; v1(65.91,16.76) 67.69,14.99 68.33,14.99 ; 无源蜂鸣器.1 48.29,34.7 v1(45.97,32.39) ; 无源蜂鸣器.1 48.56,35.04 D1.2 ; 无源蜂鸣器.1 46.82,33.83 v1(45.29,33.83) ; v1(43.31,43.43) 42.28,43.43 R3.1 43.04,42.16 v1(43.31,42.16) ; v1(38.48,41.91) 38.48,42.93 R8.2 38.85,42.32 39,42.32 v1(39.33,41.99) ; v1(41.53,15.28) 41.53,15.21 41.31,14.99 34.8,14.99 ; v1(33.91,28.32) 35.21,28.32 AT24C02_EEPROM.8 ; 35.18,29.83 35.43,29.58 AT24C02_EEPROM.8 ; 35.18,29.83 v1(34.39,30.62) ; 35.18,29.83 v1(35.18,30.61) ; AT24C02_EEPROM.8 34.52,29.46 v1(34.04,29.46) ; v1(18.8,42.42) v1(18.8,41.53) ; v1(29.34,52.81) v1(29.34,52.09) v1(29.34,51.31) 29.34,49.92 R7.2
  Top Layer w0.508: v1(9.14,53.47) v1(9.14,52.62) v1(9.14,51.7) v1(9.14,50.8) ; v1(9.14,53.47) v1(10.03,53.47) v1(11.05,53.47) v1(12.06,53.47) v1(13.08,53.47) ; v1(9.14,53.47) 11.63,50.98 C2.1 12.06,50.91 C1.1 11.76,46.61 11.76,44.88 11.94,44.7 15.62,44.7 16.89,43.43 16.89,43.18 15.62,41.91 L1.1 ; v1(18.8,42.42) v1(18.8,43.18) v1(18.8,44.07) 18.8,44.96 v1(18.67,45.08) ; v1(22.1,62.36) v1(22.1,63.12) v1(21.34,63.12) v1(20.7,63.12) v1(20.07,63.12) ; v1(22.1,62.36) v1(21.34,62.36) v1(20.7,62.36) v1(20.07,62.36) ; v1(22.1,62.36) 22.1,60.59 R1.1 ; v1(18.8,41.53) v1(18.8,40.64) v1(18.8,39.62) 17.27,38.1 R10.2
  Top Layer w0.762: v1(22.1,63.12) 23.11,64.13 C9.1 25.02,63.75 26.69,63.75 28.57,61.86 C5.2 31.62,61.86 U2.2 ; 15.62,41.91 18.42,41.91 v1(18.8,41.53)
GND: length 56.7
  Top Layer w0.254: v1(7.87,5.84) 9.82,5.84 MicroUSB.9 9.89,4.58 v1(10.03,4.44) ; v1(37.74,55.15) v1(39.14,55.15) v1(40.54,55.15) ; v1(6.98,3.18) 7.04,3.23 MicroUSB.8 ; MicroUSB.6 15.75,6.92 v1(15.75,7.24) ; AT24C02_EEPROM.4 AT24C02_EEPROM.3 AT24C02_EEPROM.2 AT24C02_EEPROM.1 ; SW6.1 17.64,55.63 C8.2 ; v1(9.14,20.57) v1(9.14,21.59) ; C6.1 53.86,47.02 SW2.1 ; MicroUSB.7 17.22,3.23 v1(17.4,3.05) ; v1(8.13,16.26) 8.13,16.38 v1(8.64,16.89) 8.76,17.02 TP4056.3
  Top Layer w0.4: C5.1 30.9,63.86 31.89,62.87
  Top Layer w0.508: C5.1 28.45,64.5 27.56,64.5 27.07,64.99 26.98,64.99 26.47,65.5 21.44,65.5 19.57,63.63 17.78,63.63 v1(17.78,63.12) ; C11.1 11.67,13.84 C4.2 9.64,10.11 C3.2 ; v1(18.29,62.36) 17.78,61.85 v1(17.78,61.59)
  Top Layer w0.762: v1(17.78,61.59) v1(18.42,60.96) ; v1(18.29,62.36) 18.29,62.61 v1(17.78,63.12) ; C9.2 25.9,61.09 v1(26.92,60.07) v1(27.69,60.07) v1(27.69,60.83) 27.31,61.21 v1(26.92,61.21)
  vias: v1(7.11,21.59) v1(7.11,20.57) v1(7.75,21.59) v1(7.8,20.57) v1(8.51,21.59) v1(8.51,20.57) v1(36.32,56.39) v1(36.32,55.12) v1(36.32,53.72) v1(37.72,57.66) v1(37.74,56.55) v1(37.72,53.72) v1(37.72,52.45) v1(39.12,57.66) v1(39.14,56.55) v1(39.14,53.75) v1(39.24,52.45) v1(40.54,53.75) v1(40.64,57.66) v1(40.64,56.55) v1(40.64,52.45) v1(41.78,56.64) v1(41.78,55.12) v1(41.78,53.72)
VBUS: length 70.1
  Top Layer w0.254: TP4056.8 6.22,22.39 arc(6.21,22.34) 6.2,22.28 6.2,19.88 arc(6.21,19.82) 6.22,19.77 6.22,19.56 6.4,19.38 8.85,19.38 9.34,18.89 9.34,18.86 TP4056.4 10.03,19.77 arc(10.05,19.82) 10.06,19.88 10.06,22.28 arc(10.05,22.34) 10.03,22.39 10.03,22.61 9.85,22.79 9.4,22.79 9.22,22.97 9.22,23.15 9.34,23.27 9.34,24.71 9.22,24.83 9.22,25.02 9.04,25.2 8.64,25.2 8.43,25.41 8.43,26.86 8.3,26.99 8.3,29.34 8.48,29.52 12.23,29.52 R12.2 13.45,35.13 R13.2
  Top Layer w0.508: MicroUSB.1 11.02,6.62 7.62,10.02 C3.1 7.64,10.11 C4.1 7.64,14.53 10.12,17.01 10.12,17.38 ; 10.12,17.38 10.12,18.09 TP4056.4 10.43,18.17 12.45,20.19 12.45,27.05 12.63,27.23 12.88,27.23 13.25,26.86 Q2.1 14.1,26.36 R14.2 ; 10.12,17.38 10.93,17.38 C11.2 14.21,16.24 16.13,18.16 D2.2
VIN: length 35.7
  Top Layer w0.508: 6.03,38.23 4.94,38.23 C10.2 ; 6.03,38.23 6.35,38.23 5.99,38.59 5.99,39.42 TLV62568_BUCK.4 6.29,40.89 6.47,41.07 7.62,41.07 7.82,41.27 7.82,41.48 7.95,41.6 7.95,41.7 8.19,41.94 TLV62568_BUCK.1 ; 6.03,38.23 8.04,36.22 14.18,36.22 18.54,31.86 D2.1 15.31,28.76 Q2.2
BAT_IN: length 2.3
  Top Layer w0.254: 37.85,39.43 37.85,40.72 R6.1
BAT_OUT: length 8.4
  Top Layer w0.254: BT1.1 32.18,35.69 32.18,41.2 32.38,41.4 R6.2
BOOT: length 19
  Top Layer w0.254: U2.27 51.3,46.36 53.47,44.2 60.45,44.2 60.63,44.38 60.63,46.39 SW2.2 62.03,46.48 62.74,47.19 63.77,47.19 64.48,46.48 R2.2
BUZZER: length 16.6
  Top Layer w0.254: D1.1 51.78,34.79 无源蜂鸣器.2
  Top Layer w0.381: 无源蜂鸣器.2 52.04,35.56 49.96,35.56 48.78,36.74 47.8,36.74 46.62,35.56 43.53,35.56 Q1.3
BUZZER_PWM: length 7.3
  Top Layer w0.381: Q1.1 41.28,36.28 41.28,37.97 ; 41.28,37.97 41.74,37.97 42.39,38.62 43.48,38.62 44.13,37.97 44.32,37.97 R5.2 ; 41.28,37.97 R15.2
D+: length 59.5
  Top Layer w0.254: MicroUSB.3 12.32,7.16 12.2,7.28 12.2,8.13 12.38,8.31 29.89,8.31 30.3,8.73 30.3,45.84 30.83,46.36 U2.14
D-: length 60.8
  Top Layer w0.254: MicroUSB.2 11.67,7.16 11.79,7.28 11.79,8.3 12.21,8.71 29.72,8.71 29.9,8.89 29.9,46.41 31.12,47.63 U2.13
DS_WAKE_UP_GPIO15: length 12.5
  Top Layer w0.254: U2.20 40,42.66 ; 40,42.66 40,41.66 38.96,40.61 38.88,40.61 38.54,40.27 38.54,40.19 38.48,40.13 38.48,34.86 U3.3 ; 40,42.66 R3.2
FB: length 7.9
  Top Layer w0.254: TLV62568_BUCK.5 9.19,39.72 R11.1 11.16,38.1 12.13,39.07 13.49,39.07 14.46,38.1 R10.1
KEY_ENTER: length 68.9
  Top Layer w0.254: U2.25 46.35,44.4 47.24,43.51 70.99,43.51 71.45,43.05 71.45,7.38 71.03,6.96 68.28,6.96 SW5.1
KEY_LEFT: length 89.8
  Top Layer w0.254: U2.23 44.36,44.54 44.36,44.21 45.77,42.8 70.49,42.8 70.74,42.55 70.74,7.67 70.31,7.67 70.23,7.75 48.58,7.75 SW3.1
KEY_RIGHT: length 79.3
  Top Layer w0.254: SW4.1 58.23,7.32 70.89,7.32 71.09,7.53 71.09,42.9 70.84,43.16 47.01,43.16 46.11,44.05 45.79,44.05 45.63,44.21 45.63,44.54 U2.24
LED: length 7.2
  Top Layer w0.254: LED4.2 7.59,30.1 7.59,26.57 7.72,26.45 7.72,24.21 TP4056.7
LED1: length 12.4
  Top Layer w0.254: LED3.2 8.64,33.37 8.64,31.91 7.95,31.22 7.95,26.84 8.07,26.71 8.07,24.68 TP4056.6
LED_VCC: length 2.4
  Top Layer w0.254: LED4.1 R12.1
LED_VCC1: length 2.4
  Top Layer w0.254: LED3.1 11.37,35.05 R13.1
POWER_BAT_IN: length 7.1
  Top Layer w0.762: TP4056.5 10.03,26.24 9.61,26.67 10.15,26.67 Q2.3 10.83,28.27 R16.2
POWER_BAT_IN_RAW: length 5.4
  Top Layer w0.762: R16.1 6.5,26.32 5.41,25.23 5.41,25.15 4.98,24.72 3.86,24.72 MX1.25电池连接器.2
RST: length 11
  Top Layer w0.254: SW6.2 25.29,58.9 R1.2 30.49,58.93 30.86,59.3 30.86,59.63 31.02,59.79 31.35,59.79 U2.3
RX: length 8.2
  Top Layer w0.254: 49.39,57.79 50.67,57.79 51.64,56.82 51.64,55.35 51.8,55.18 53.61,55.18 54.69,56.26 H1.2
SCL: length 101.5
  Top Layer w0.254: R7.1 28.58,48.9 U2.12 32.43,48.36 32.76,48.36 32.92,48.2 32.92,45.79 32.89,45.77 32.93,45.74 32.93,44.21 33.09,44.05 34.22,44.05 34.29,44.12 34.36,44.05 34.61,44.05 35.31,43.36 35.31,39.43 36,38.73 36,33.39 36.07,33.32 36.07,30.72 37.27,29.51 37.27,29.25 AT24C02_EEPROM.6 37.97,25.15 38.81,24.31 39.48,24.31 39.81,23.98 39.81,23.31 42.54,20.57 60.2,20.57 U4.3 H2.2
SDA: length 94.5
  Top Layer w0.254: 36.46,43.82 35.69,43.05 35.69,40.47 35.88,40.27 35.88,39.94 36.39,39.43 36.58,39.43 37.27,38.73 37.27,33.39 37.64,33.02 39.24,33.02 39.5,32.77 39.5,28.8 AT24C02_EEPROM.5 46.86,20.93 60.35,20.93 67.7,13.58 68.79,13.58 69.46,12.91 69.46,11.98 68.33,10.85 U4.4 H2.1 ; 36.46,43.82 36.46,44.82 U2.17 ; 36.46,43.82 36.97,43.31 R8.1
TX: length 4.5
  Top Layer w0.254: U2.37 49.91,59.06 H1.1
$1N150: length 3.8
  Top Layer w0.381: U2.21 R15.1
$1N182: length 7.8
  Top Layer w0.508: TLV62568_BUCK.3 6.29,43.94 6.47,44.12 9.4,44.12 11.18,42.34 L1.2
$2N7: length 5
  Top Layer w0.508: TP4056.2 7.67,17.99 7.67,17.12 7.49,16.94 4.11,16.94 R9.2

## Copper pours and planes (outline as drawn; the poured copper is in the pictures)
3.3V on Inner2: 1.2,64.5 80.9,64.5 80.9,1.27 1.2,1.27
GND on Top Layer: 1.27,64.01 81.03,64.01 81.03,1.4 1.27,1.4
GND on Inner1: 1.27,64.5 80.77,64.5 80.77,1.27 1.27,1.27
GND on Inner1: 1.78,64.52 80.77,64.52 80.77,1.65 1.78,1.65

## Text on the board
Bottom Silkscreen Layer: 一个月的心血 | 梦想总是遥不可及, / 是不是应该放弃。。。
Top Silkscreen Layer: BAT+ | DS3231 | UART | TX | RX | GND | 2.4 GHz 802.11 b/g/n + Bluetooth LE 5.0 | SoC:Xtensa LX7 32bit *2@240Mhz | RAM:512KB SRAM+8MB PSRAM | Flash:16MB | 3.3V | CERN-OHL-S-2.0 | Powered by | CR1220 | SCL | SDA | ESP32-S3_Clock | - | + | RST | JTAG | V3.0 | <- | BOOT | -> | https://github.com/louhui-hello/ESP32-S3_Clock | ESP32-S3-WROOM-1-N16R8 | QR Code | 0.91寸OLED(128x32) | 开源是种浪漫！ / Open Source is Love! | 4层PCB | 满电 | 充电 | 为什么要取这个域名，请见keil.fuckarm.com | 强互惠开源硬件协议 | @学 ARM Keil 的初中生 | 访问官网:esp32.fuckarm.com | ESP-IDF开发 | 确定
